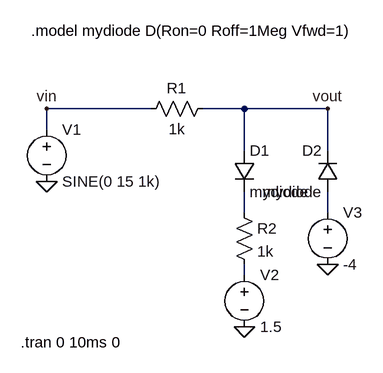
[diagram p0: schematic exp2.asc]
exp2.asc, the LTspice schematic file:
Version 4.1
SHEET 1 1116 680
WIRE 256 80 96 80
WIRE 400 80 336 80
WIRE 528 80 400 80
WIRE 96 112 96 80
WIRE 400 144 400 80
WIRE 528 144 528 80
WIRE 400 240 400 208
WIRE 528 240 528 208
WIRE 400 336 400 320
FLAG 96 192 0
FLAG 400 416 0
FLAG 528 320 0
FLAG 528 80 vout
FLAG 96 80 vin
SYMBOL voltage 96 96 R0
WINDOW 123 0 0 Left 0
WINDOW 39 0 0 Left 0
SYMATTR InstName V1
SYMATTR Value SINE(0 15 1k)
SYMBOL res 352 64 R90
WINDOW 0 0 56 VBottom 2
WINDOW 3 32 56 VTop 2
SYMATTR InstName R1
SYMATTR Value 1k
SYMBOL diode 384 144 R0
SYMATTR InstName D1
SYMATTR Value mydiode
SYMBOL res 384 224 R0
SYMATTR InstName R2
SYMATTR Value 1k
SYMBOL voltage 400 320 R0
WINDOW 123 0 0 Left 0
WINDOW 39 0 0 Left 0
SYMATTR InstName V2
SYMATTR Value 1.5
SYMBOL voltage 528 224 R0
WINDOW 123 0 0 Left 0
WINDOW 39 0 0 Left 0
SYMATTR InstName V3
SYMATTR Value -4
SYMBOL diode 544 208 R180
WINDOW 0 24 64 Left 2
WINDOW 3 24 0 Left 2
SYMATTR InstName D2
SYMATTR Value mydiode
TEXT 72 -40 Left 2 !.model mydiode D(Ron=0 Roff=1Meg Vfwd=1)
TEXT 56 440 Left 2 !.tran 0 10ms 0

The netlist it stands for:
* exp2.asc
V1 vin 0 SINE(0 15 1k)
R1 vout vin 1k
D1 vout N001 mydiode
R2 N001 N003 1k
V2 N003 0 1.5
V3 N002 0 -4
D2 N002 vout mydiode
.model D D
.lib standard.dio
.model mydiode D(Ron=0 Roff=1Meg Vfwd=1)
.tran 0 10ms 0
.backanno
.end